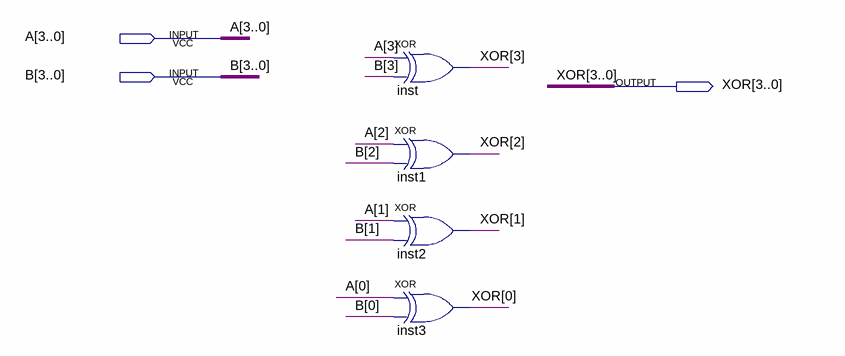
[diagram p0: schematic sheet]
// Quartus schematic XOR_4bit.bdf as structural Verilog: 4 symbols, 3 pins
module XOR_4bit (
  input  [3:0] A,
  input  [3:0] B,
  output [3:0] XOR
);

  xor inst (XOR[3], A[3], B[3]);
  xor inst1 (XOR[2], A[2], B[2]);
  xor inst2 (XOR[1], A[1], B[1]);
  xor inst3 (XOR[0], A[0], B[0]);
endmodule
